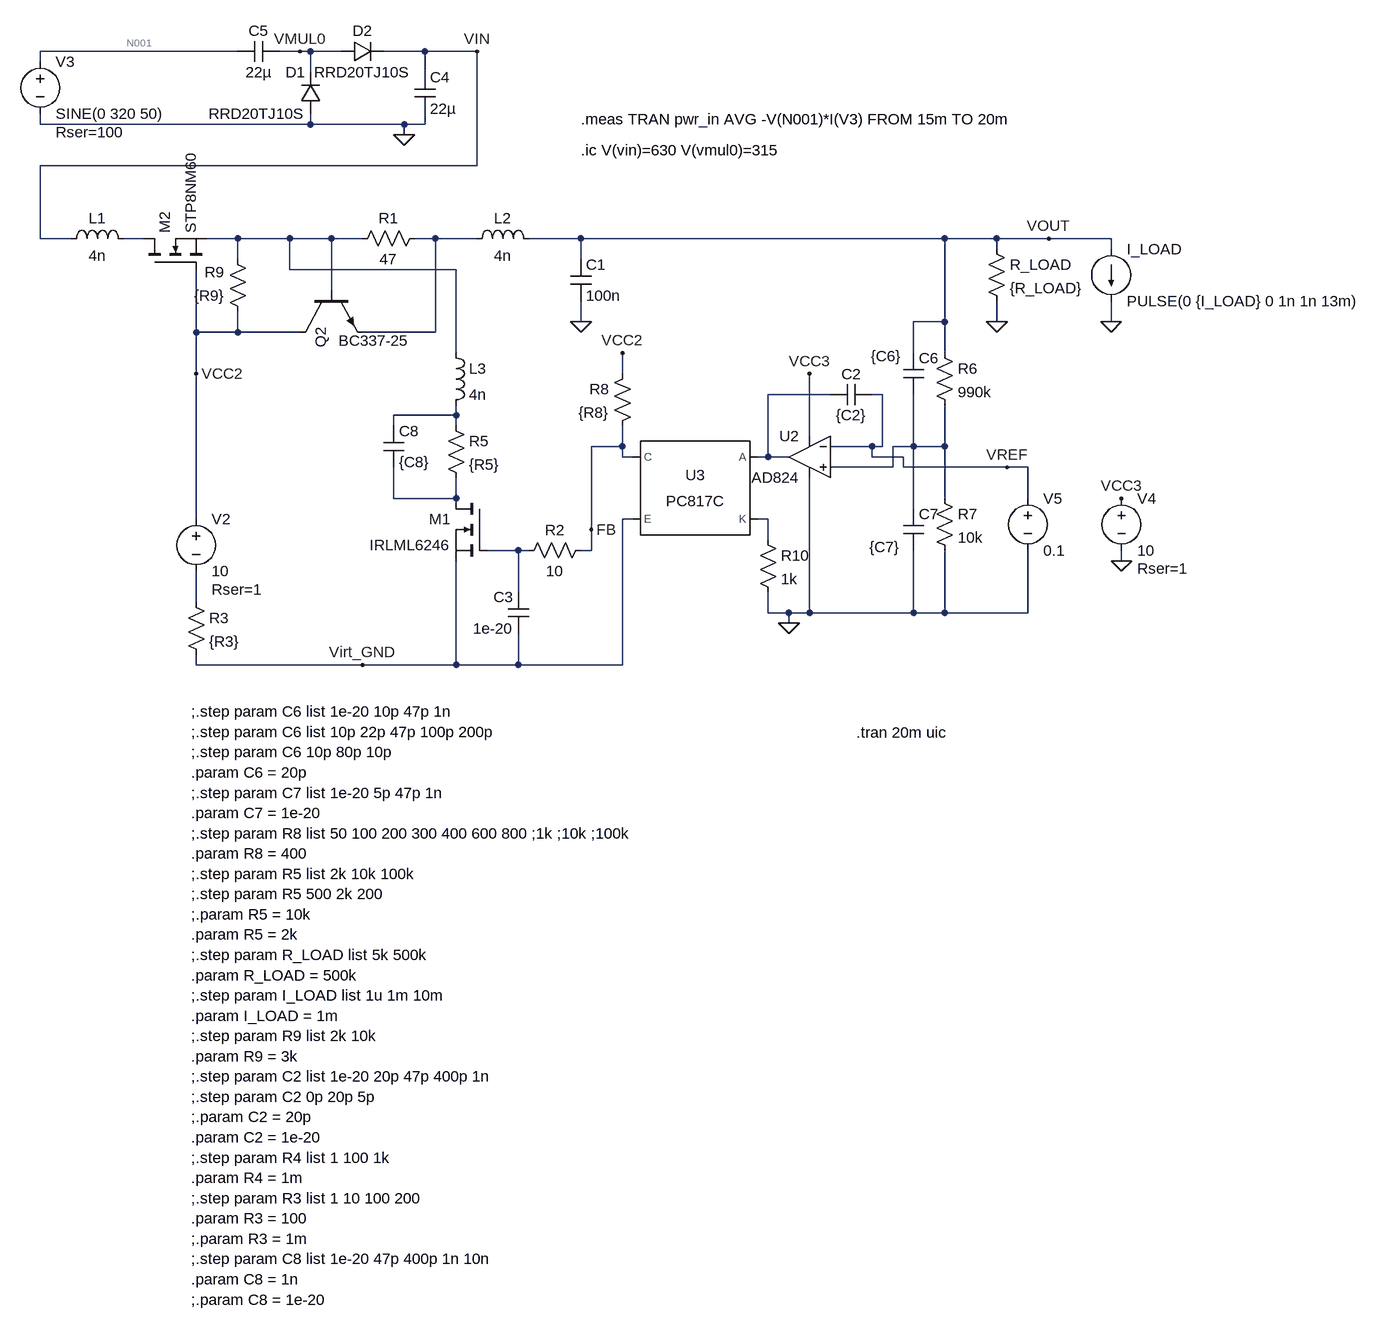
[diagram p0: schematic high_voltage_power_supply_rev.asc]
high_voltage_power_supply_rev.asc, the LTspice schematic file:
Version 4
SHEET 1 2392 1556
WIRE 464 -288 160 -288
WIRE 560 -288 528 -288
WIRE 576 -288 560 -288
WIRE 624 -288 576 -288
WIRE 752 -288 688 -288
WIRE 832 -288 752 -288
WIRE 160 -272 160 -288
WIRE 576 -256 576 -288
WIRE 752 -256 752 -288
WIRE 160 -176 160 -192
WIRE 576 -176 576 -192
WIRE 576 -176 160 -176
WIRE 720 -176 576 -176
WIRE 752 -176 752 -192
WIRE 752 -176 720 -176
WIRE 720 -160 720 -176
WIRE 832 -112 832 -288
WIRE 832 -112 160 -112
WIRE 160 0 160 -112
WIRE 208 0 160 0
WIRE 320 0 288 0
WIRE 464 0 416 0
WIRE 544 0 464 0
WIRE 608 0 544 0
WIRE 656 0 608 0
WIRE 768 0 736 0
WIRE 832 0 768 0
WIRE 992 0 912 0
WIRE 1552 0 992 0
WIRE 1632 0 1552 0
WIRE 1712 0 1632 0
WIRE 1808 0 1712 0
WIRE 1632 16 1632 0
WIRE 1808 16 1808 0
WIRE 464 32 464 0
WIRE 992 32 992 0
WIRE 544 48 544 0
WIRE 800 48 544 48
WIRE 608 80 608 0
WIRE 992 128 992 96
WIRE 1552 128 1552 0
WIRE 1552 128 1504 128
WIRE 1632 128 1632 96
WIRE 1808 128 1808 96
WIRE 400 144 400 48
WIRE 464 144 464 112
WIRE 464 144 400 144
WIRE 560 144 464 144
WIRE 768 144 768 0
WIRE 768 144 656 144
WIRE 800 176 800 48
WIRE 1504 176 1504 128
WIRE 1552 176 1552 128
WIRE 400 208 400 144
WIRE 1056 208 1056 176
WIRE 1376 240 1280 240
WIRE 1456 240 1440 240
WIRE 800 272 800 256
WIRE 800 272 704 272
WIRE 704 288 704 272
WIRE 800 288 800 272
WIRE 1344 304 1344 208
WIRE 1056 320 1056 288
WIRE 1056 320 1008 320
WIRE 1440 320 1376 320
WIRE 1456 320 1456 240
WIRE 1456 320 1440 320
WIRE 1504 320 1504 240
WIRE 1504 320 1472 320
WIRE 1552 320 1552 256
WIRE 1552 320 1504 320
WIRE 1056 336 1056 320
WIRE 1072 336 1056 336
WIRE 1280 336 1280 240
WIRE 1280 336 1264 336
WIRE 1312 336 1280 336
WIRE 1440 336 1440 320
WIRE 1488 336 1440 336
WIRE 1472 352 1472 320
WIRE 1472 352 1376 352
WIRE 1488 352 1488 336
WIRE 1648 352 1488 352
WIRE 1680 352 1648 352
WIRE 704 400 704 352
WIRE 800 400 800 368
WIRE 800 400 704 400
WIRE 1552 400 1552 320
WIRE 1680 400 1680 352
WIRE 1504 416 1504 320
WIRE 400 432 400 208
WIRE 1072 432 1056 432
WIRE 1280 432 1264 432
WIRE 1008 448 1008 320
WIRE 1280 464 1280 432
WIRE 896 480 848 480
WIRE 912 480 896 480
WIRE 1008 480 1008 448
WIRE 1008 480 992 480
WIRE 1824 496 1824 480
WIRE 896 544 896 480
WIRE 400 560 400 512
WIRE 1280 576 1280 544
WIRE 1312 576 1280 576
WIRE 1344 576 1344 368
WIRE 1344 576 1312 576
WIRE 1504 576 1504 480
WIRE 1504 576 1344 576
WIRE 1552 576 1552 480
WIRE 1552 576 1504 576
WIRE 1680 576 1680 480
WIRE 1680 576 1552 576
WIRE 1312 592 1312 576
WIRE 400 656 400 640
WIRE 656 656 400 656
WIRE 800 656 800 496
WIRE 800 656 656 656
WIRE 896 656 896 608
WIRE 896 656 800 656
WIRE 1056 656 1056 432
WIRE 1056 656 896 656
FLAG 992 128 0
FLAG 1632 128 0
FLAG 1712 0 VOUT
FLAG 1824 496 0
FLAG 400 208 VCC2
FLAG 1008 448 FB
FLAG 1056 176 VCC2
FLAG 1648 352 VREF
FLAG 720 -160 0
FLAG 832 -288 VIN
FLAG 1824 400 VCC3
FLAG 1344 208 VCC3
FLAG 1808 128 0
FLAG 1312 592 0
FLAG 560 -288 VMUL0
FLAG 656 656 Virt_GND
SYMBOL npn 560 80 M90
WINDOW 3 77 59 VRight 2
SYMATTR Value BC337-25
SYMATTR InstName Q2
SYMBOL res 640 16 R270
WINDOW 0 32 56 VTop 2
WINDOW 3 0 56 VBottom 2
SYMATTR InstName R1
SYMATTR Value 47
SYMBOL cap 976 32 R0
SYMATTR InstName C1
SYMATTR Value 100n
SYMATTR SpiceLine V=1000
SYMBOL res 1616 0 R0
SYMATTR InstName R_LOAD
SYMATTR Value {R_LOAD}
SYMBOL res 784 272 R0
SYMATTR InstName R5
SYMATTR Value {R5}
SYMBOL voltage 400 416 R0
WINDOW 123 0 0 Left 0
WINDOW 39 24 124 Left 2
SYMATTR SpiceLine Rser=1
SYMATTR InstName V2
SYMATTR Value 10
SYMBOL voltage 1824 384 R0
WINDOW 123 0 0 Left 0
WINDOW 39 24 124 Left 2
SYMATTR SpiceLine Rser=1
SYMATTR InstName V4
SYMATTR Value 10
SYMBOL res 1536 160 R0
SYMATTR InstName R6
SYMATTR Value 990k
SYMBOL res 1536 384 R0
SYMATTR InstName R7
SYMATTR Value 10k
SYMBOL res 1264 448 R0
SYMATTR InstName R10
SYMATTR Value 1k
SYMBOL Optos\\PC817C 1168 384 M0
SYMATTR InstName U3
SYMBOL cap 1440 224 R90
WINDOW 0 0 32 VBottom 2
WINDOW 3 32 32 VTop 2
SYMATTR InstName C2
SYMATTR Value {C2}
SYMBOL cap 912 544 M0
SYMATTR InstName C3
SYMATTR Value 1e-20
SYMBOL voltage 1680 384 R0
WINDOW 123 0 0 Left 0
WINDOW 39 0 0 Left 0
SYMATTR InstName V5
SYMATTR Value 0.1
SYMBOL res 1072 192 M0
SYMATTR InstName R8
SYMATTR Value {R8}
SYMBOL res 480 128 R180
WINDOW 0 36 76 Left 2
WINDOW 3 36 40 Left 2
SYMATTR InstName R9
SYMATTR Value {R9}
SYMBOL ind 192 16 R270
WINDOW 0 32 56 VTop 2
WINDOW 3 5 56 VBottom 2
SYMATTR InstName L1
SYMATTR Value 4n
SYMBOL ind 816 16 R270
WINDOW 0 32 56 VTop 2
WINDOW 3 5 56 VBottom 2
SYMATTR InstName L2
SYMATTR Value 4n
SYMBOL ind 784 160 R0
SYMATTR InstName L3
SYMATTR Value 4n
SYMBOL voltage 160 -288 R0
WINDOW 123 0 0 Left 0
WINDOW 39 24 124 Left 2
SYMATTR SpiceLine Rser=100
SYMATTR InstName V3
SYMATTR Value SINE(0 320 50)
SYMBOL cap 736 -256 R0
SYMATTR InstName C4
SYMATTR Value 22µ
SYMBOL cap 528 -304 R90
WINDOW 0 0 32 VBottom 2
WINDOW 3 32 32 VTop 2
SYMATTR InstName C5
SYMATTR Value 22µ
SYMBOL diode 592 -192 R180
WINDOW 0 24 64 Left 2
WINDOW 3 24 0 Left 2
SYMATTR InstName D1
SYMATTR Value RRD20TJ10S
SYMBOL diode 624 -272 R270
WINDOW 0 32 32 VTop 2
WINDOW 3 0 32 VBottom 2
SYMATTR InstName D2
SYMATTR Value RRD20TJ10S
SYMBOL cap 1488 176 R0
WINDOW 3 -50 5 Left 2
SYMATTR Value {C6}
SYMATTR InstName C6
SYMBOL current 1808 16 R0
WINDOW 123 0 0 Left 0
WINDOW 39 0 0 Left 0
SYMATTR InstName I_LOAD
SYMATTR Value PULSE(0 {I_LOAD} 0 1n 1n 13m)
SYMBOL nmos 320 48 R270
SYMATTR InstName M2
SYMATTR Value STP8NM60
SYMBOL cap 1488 416 R0
WINDOW 3 -52 59 Left 2
SYMATTR Value {C7}
SYMATTR InstName C7
SYMBOL res 1008 464 R90
WINDOW 0 0 56 VBottom 2
WINDOW 3 32 56 VTop 2
SYMATTR InstName R2
SYMATTR Value 10
SYMBOL nmos 848 400 M0
SYMATTR InstName M1
SYMATTR Value IRLML6246
SYMBOL res 384 544 R0
SYMATTR InstName R3
SYMATTR Value {R3}
SYMBOL cap 688 288 R0
SYMATTR InstName C8
SYMATTR Value {C8}
SYMBOL OpAmps\\AD824 1344 272 M0
SYMATTR InstName U2
TEXT 1416 760 Left 2 !.tran 20m uic
TEXT 392 728 Left 2 !;.step param C6 list 1e-20 10p 47p 1n\n;.step param C6 list 10p 22p 47p 100p 200p\n;.step param C6 10p 80p 10p\n.param C6 = 20p\n;.step param C7 list 1e-20 5p 47p 1n\n.param C7 = 1e-20\n;.step param R8 list 50 100 200 300 400 600 800 ;1k ;10k ;100k\n.param R8 = 400\n;.step param R5 list 2k 10k 100k\n;.step param R5 500 2k 200\n;.param R5 = 10k\n.param R5 = 2k\n;.step param R_LOAD list 5k 500k\n.param R_LOAD = 500k\n;.step param I_LOAD list 1u 1m 10m\n.param I_LOAD = 1m\n;.step param R9 list 2k 10k\n.param R9 = 3k\n;.step param C2 list 1e-20 20p 47p 400p 1n\n;.step param C2 0p 20p 5p\n;.param C2 = 20p\n.param C2 = 1e-20\n;.step param R4 list 1 100 1k\n.param R4 = 1m\n;.step param R3 list 1 10 100 200\n.param R3 = 100\n;.param R3 = 1m\n;.step param C8 list 1e-20 47p 400p 1n 10n\n.param C8 = 1n\n;.param C8 = 1e-20
TEXT 992 -184 Left 2 !.meas TRAN pwr_in AVG -V(N001)*I(V3) FROM 15m TO 20m
TEXT 992 -136 Left 2 !.ic V(vin)=630 V(vmul0)=315

The netlist it stands for:
* high_voltage_power_supply_rev.asc
Q2 VCC2 N003 N004 0 BC337-25
R1 N003 N004 47
C1 VOUT 0 100n V=1000
R_LOAD VOUT 0 {R_LOAD}
R5 N006 N008 {R5}
V2 VCC2 N011 10 Rser=1
V4 VCC3 0 10 Rser=1
R6 VOUT N007 990k
R7 N007 0 10k
R10 N009 0 1k
XU3 N005 N009 FB Virt_GND PC817 Igain=2.3m  ; PC817C, pins A K C E
C2 VREF N005 {C2}
C3 N010 Virt_GND 1e-20
V5 VREF 0 0.1
R8 VCC2 FB {R8}
R9 VCC2 N003 {R9}
L1 VIN N002 4n
L2 N004 VOUT 4n
L3 N003 N006 4n
V3 N001 0 SINE(0 320 50) Rser=100
C4 VIN 0 22µ
C5 VMUL0 N001 22µ
D1 0 VMUL0 RRD20TJ10S
D2 VMUL0 VIN RRD20TJ10S
C6 VOUT N007 {C6}
I_LOAD VOUT 0 PULSE(0 {I_LOAD} 0 1n 1n 13m)
M2 N002 VCC2 N003 N003 STP8NM60
C7 N007 0 {C7}
R2 FB N010 10
M1 N008 N010 Virt_GND Virt_GND IRLML6246
R3 N011 Virt_GND {R3}
C8 N006 N008 {C8}
XU2 N007 VREF VCC3 0 N005 AD824  ; pins In+ In- V+ V- OUT
.model D D
.lib standard.dio
.model NPN NPN
.model PNP PNP
.lib standard.bjt
.model NMOS NMOS
.model PMOS PMOS
.lib standard.mos
.tran 20m uic
;.step param C6 list 1e-20 10p 47p 1n
;.step param C6 list 10p 22p 47p 100p 200p
;.step param C6 10p 80p 10p
.param C6 = 20p
;.step param C7 list 1e-20 5p 47p 1n
.param C7 = 1e-20
;.step param R8 list 50 100 200 300 400 600 800 ;1k ;10k ;100k
.param R8 = 400
;.step param R5 list 2k 10k 100k
;.step param R5 500 2k 200
;.param R5 = 10k
.param R5 = 2k
;.step param R_LOAD list 5k 500k
.param R_LOAD = 500k
;.step param I_LOAD list 1u 1m 10m
.param I_LOAD = 1m
;.step param R9 list 2k 10k
.param R9 = 3k
;.step param C2 list 1e-20 20p 47p 400p 1n
;.step param C2 0p 20p 5p
;.param C2 = 20p
.param C2 = 1e-20
;.step param R4 list 1 100 1k
.param R4 = 1m
;.step param R3 list 1 10 100 200
.param R3 = 100
;.param R3 = 1m
;.step param C8 list 1e-20 47p 400p 1n 10n
.param C8 = 1n
;.param C8 = 1e-20
.meas TRAN pwr_in AVG -V(N001)*I(V3) FROM 15m TO 20m
.ic V(vin)=630 V(vmul0)=315
.lib PC817.sub
.backanno
.end